# Altium schematic sheet MCU.SchDoc
size A; SheetNumber: 4; SheetTotal: 9
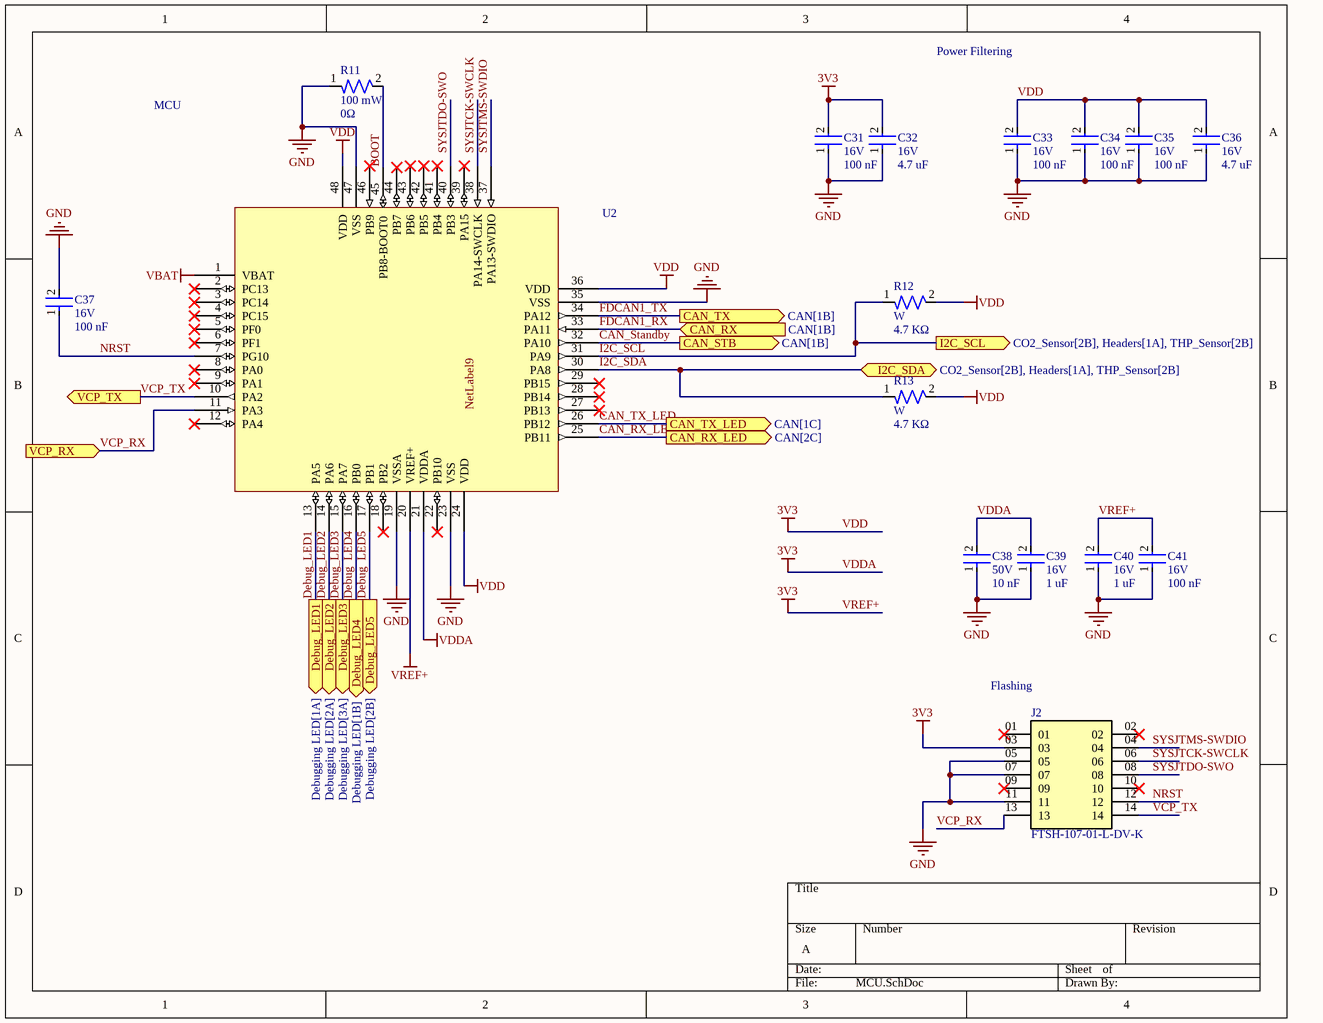
[diagram p0: MCU.SchDoc]

## Parts
C31  Voltage Rating: 16V  Capacitance: 100 nF  [CAP-0603]  (hidden comment: CAP 0603)
C32  Voltage Rating: 16V  Capacitance: 4.7 uF  [CAP-0603]  (hidden comment: CAP 0603)
C33  Voltage Rating: 16V  Capacitance: 100 nF  [CAP-0603]  (hidden comment: CAP 0603)
C34  Voltage Rating: 16V  Capacitance: 100 nF  [CAP-0603]  (hidden comment: CAP 0603)
C35  Voltage Rating: 16V  Capacitance: 100 nF  [CAP-0603]  (hidden comment: CAP 0603)
C36  Voltage Rating: 16V  Capacitance: 4.7 uF  [CAP-0603]  (hidden comment: CAP 0603)
C37  Voltage Rating: 16V  Capacitance: 100 nF  [CAP-0603]  (hidden comment: CAP 0603)
C38  Voltage Rating: 50V  Capacitance: 10 nF  [CAP-0603]  (hidden comment: CAP 0603)
C39  Voltage Rating: 16V  Capacitance: 1 uF  [CAP-0603]  (hidden comment: CAP 0603)
C40  Voltage Rating: 16V  Capacitance: 1 uF  [CAP-0603]  (hidden comment: CAP 0603)
C41  Voltage Rating: 16V  Capacitance: 100 nF  [CAP-0603]  (hidden comment: CAP 0603)
J2  FTSH-107-01-L-DV-K  [SAMTEC_FTSH-107-01-L-DV-K]
R11  Wattage: 100 mW  Resistance: 0Ω  [RES-0603]  (hidden comment: RES 0603)
R12  Wattage: W  Resistance: 4.7 KΩ  [RES-0603]  (hidden comment: RES 0603)
R13  Wattage: W  Resistance: 4.7 KΩ  [RES-0603]  (hidden comment: RES 0603)
U2  STM32G431CBT6  [IC-LQFP48]  (value not drawn)

## Ports
CAN_RX (in, see CAN[1B]), CAN_RX_LED (out, see CAN[2C]), CAN_STB (out, see CAN[1B]), CAN_TX (out, see CAN[1B]), CAN_TX_LED (out, see CAN[1C]), Debug_LED1 (out, see Debugging LED[1A]), Debug_LED2 (out, see Debugging LED[2A]), Debug_LED3 (out, see Debugging LED[3A]), Debug_LED4 (out, see Debugging LED[1B]), Debug_LED5 (out, see Debugging LED[2B]), I2C_SCL (out, see CO2_Sensor[2B], Headers[1A], THP_Sensor[2B]), I2C_SDA (bidir, see CO2_Sensor[2B], Headers[1A], THP_Sensor[2B]), VCP_RX (in), VCP_TX (out)

## Nets
GND: C31.1 C32.1 C33.1 C34.1 C35.1 C36.1 C37.2 C38.1 C39.1 C40.1 C41.1 J2.05 J2.07 J2.11 R11.1 U2.19(VSSA) U2.23(VSS) U2.35(VSS) U2.47(VSS)
VBAT: U2.1(VBAT)
VDD: C31.2 C32.2 C33.2 C34.2 C35.2 C36.2 C38.2 C39.2 C40.2 C41.2 J2.03 R12.2 R13.2 U2.20(VREF+) U2.21(VDDA) U2.24(VDD) U2.36(VDD) U2.48(VDD)  [also labelled 3V3, VDDA, VREF+]
BOOT: R11.2 U2.45(PB8-BOOT0)
CAN_RX_LED: U2.25(PB11) ; port CAN_RX_LED
CAN_Standby: U2.32(PA10) ; port CAN_STB
CAN_TX_LED: U2.26(PB12) ; port CAN_TX_LED
Debug  LED4: U2.16(PB0) ; port Debug_LED4
Debug  LED5: U2.17(PB1) ; port Debug_LED5
Debug_LED1: U2.13(PA5) ; port Debug_LED1
Debug_LED2: U2.14(PA6) ; port Debug_LED2
Debug_LED3: U2.15(PA7) ; port Debug_LED3
FDCAN1_RX: U2.33(PA11) ; port CAN_RX
FDCAN1_TX: U2.34(PA12) ; port CAN_TX
I2C_SCL: R12.1 U2.31(PA9) ; port I2C_SCL
I2C_SDA: R13.1 U2.30(PA8) ; port I2C_SDA
NRST: C37.1 J2.12 U2.7(PG10)
SYSJTCK-SWCLK: J2.06 U2.38(PA14-SWCLK)
SYSJTDO-SWO: J2.08 U2.40(PB3)
SYSJTMS-SWDIO: J2.04 U2.37(PA13-SWDIO)
VCP_RX: J2.13 U2.11(PA3) ; port VCP_RX
VCP_TX: J2.14 U2.10(PA2) ; port VCP_TX

Not connected (* = marked no-connect by the designer): J2 01* 02* 09* 10*; U2 2(PC13)* 3(PC14)* 4(PC15)* 5(PF0)* 6(PF1)* 8(PA0)* 9(PA1)* 12(PA4)* 18(PB2)* 22(PB10)* 27(PB13)* 28(PB14)* 29(PB15)* 39(PA15)* 41(PB4)* 42(PB5)* 43(PB6)* 44(PB7) 46(PB9)*

## Notes on the sheet
- Power Filtering
- MCU
- (near J2) Flashing
- Labels drawn without touching a wire or pin: NetLabel9

## Library data of the parts
J2 = CONN_Flashing-0001: Connector Header Surface Mount 14 position 0.050" (1.27mm); MF: Samtec; Value: *; Price: None; Package: None; Availability: Unavailable; MP: FTSH-107-01-L-DV-K; ComponentLink1Description: Datasheet; ComponentLink1URL: https://mm.digikey.com/Volume0/opasdata/d220001/medias/docus/6209/ftsh-1xx-xx-xxx-dv-xxx-xxx-x-xx-mkt.pdf
U2 = IC-STM32G431CBT6: IC MCU 32BIT 128KB FLASH 48LQFP; Package: 48LQFP; ComponentLink1Description: Datasheet; ComponentLink1URL: https://www.st.com/resource/en/datasheet/stm32g431cb.pdf